# Altium project ProgrammingAdapter.PrjPcb
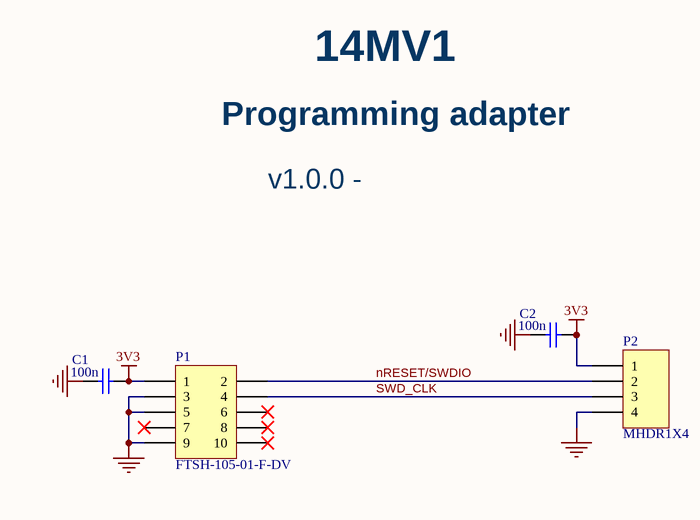
[diagram p0: Programming adapter.SchDoc]
1 sheet, 4 parts. Net scope: global (net labels, ports and power ports of the same name join across sheets).
Board file: ProgrammingAdapter.PcbDoc

## Sheet Programming adapter.SchDoc
size A4

### Parts
C1  100n  [0402]
C2  100n  [0402]
P1  FTSH-105-01-F-DV  [FTSH-105-01-F-DV-K]
P2  MHDR1X4  [MOLEX_4_V]

### Nets
3V3: C1.1 C2.1 P1.1 P2.1
GND: C1.2 C2.2 P1.3 P1.5 P1.9 P2.4
nRESET/SWDIO: P1.2 P2.2
SWD_CLK: P1.4 P2.3

Not connected (* = marked no-connect by the designer): P1 6* 7* 8* 10*

### Notes on the sheet
- 14MV1
- Programming adapter
- v1.0.0 -

### Library data of the parts
C1 C2 = Cap 100nF: Capacitor; Published: 8-Jun-2000; LatestRevisionDate: 17-Jul-2002; LatestRevisionNote: Re-released for DXP Platform.; Publisher: Altium Limited
P1 = Header 5X2: Header, 5-Pin, Dual row; LatestRevisionDate: 17-Jul-2002; LatestRevisionNote: Re-released for DXP Platform.; Publisher: Altium Limited; Supplier 1: Digi-Key; Supplier Part Number 1: SAM13159CT-ND; Supplier 2: Mouser; Supplier Part Number 2: 200-FTSH10501FDVKPTR
P2 = MHDR1X4: Header, 4-Pin; LatestRevisionDate: 17-Jul-2002; LatestRevisionNote: Re-released for DXP Platform.; Publisher: Altium Limited